# Altium schematic sheet Schematic_tm1637_.schdoc
size 281 x 104 mm
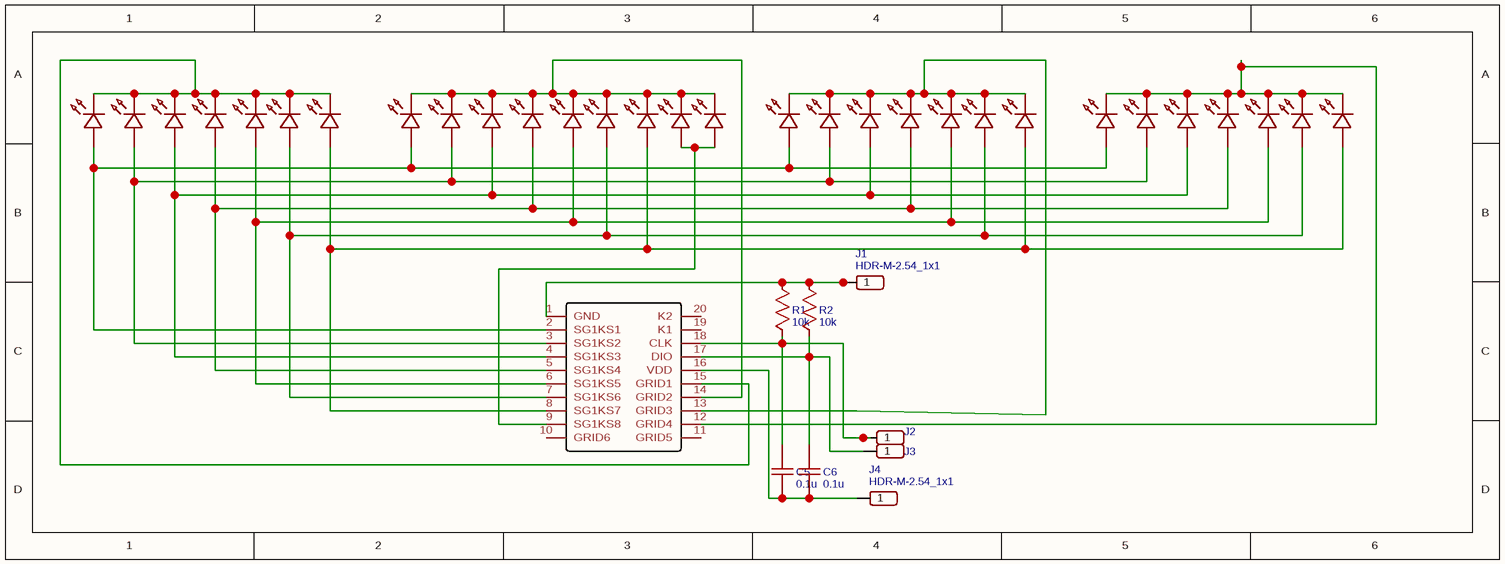
[diagram p0: Schematic_tm1637_.schdoc]

## Parts
A1  LED-TH-3mm_R  [LED-TH_BD3.0_RED]  (value not drawn)
A2  LED-TH-3mm_R  [LED-TH_BD3.0_RED]  (value not drawn)
A3  LED-TH-3mm_R  [LED-TH_BD3.0_RED]  (value not drawn)
A4  LED-TH-3mm_R  [LED-TH_BD3.0_RED]  (value not drawn)
B1  LED-TH-3mm_R  [LED-TH_BD3.0_RED]  (value not drawn)
B2  LED-TH-3mm_R  [LED-TH_BD3.0_RED]  (value not drawn)
B3  LED-TH-3mm_R  [LED-TH_BD3.0_RED]  (value not drawn)
B4  LED-TH-3mm_R  [LED-TH_BD3.0_RED]  (value not drawn)
C1  LED-TH-3mm_R  [LED-TH_BD3.0_RED]  (value not drawn)
C2  LED-TH-3mm_R  [LED-TH_BD3.0_RED]  (value not drawn)
C3  LED-TH-3mm_R  [LED-TH_BD3.0_RED]  (value not drawn)
C4  LED-TH-3mm_R  [LED-TH_BD3.0_RED]  (value not drawn)
C5  0.1u  [C1206]
C6  0.1u  [C1206]
D1  LED-TH-3mm_R  [LED-TH_BD3.0_RED]  (value not drawn)
D2  LED-TH-3mm_R  [LED-TH_BD3.0_RED]  (value not drawn)
D3  LED-TH-3mm_R  [LED-TH_BD3.0_RED]  (value not drawn)
D4  LED-TH-3mm_R  [LED-TH_BD3.0_RED]  (value not drawn)
E1  LED-TH-3mm_R  [LED-TH_BD3.0_RED]  (value not drawn)
E2  LED-TH-3mm_R  [LED-TH_BD3.0_RED]  (value not drawn)
E3  LED-TH-3mm_R  [LED-TH_BD3.0_RED]  (value not drawn)
E4  LED-TH-3mm_R  [LED-TH_BD3.0_RED]  (value not drawn)
F1  LED-TH-3mm_R  [LED-TH_BD3.0_RED]  (value not drawn)
F2  LED-TH-3mm_R  [LED-TH_BD3.0_RED]  (value not drawn)
F3  LED-TH-3mm_R  [LED-TH_BD3.0_RED]  (value not drawn)
F4  LED-TH-3mm_R  [LED-TH_BD3.0_RED]  (value not drawn)
G1  LED-TH-3mm_R  [LED-TH_BD3.0_RED]  (value not drawn)
G2  LED-TH-3mm_R  [LED-TH_BD3.0_RED]  (value not drawn)
G3  LED-TH-3mm_R  [LED-TH_BD3.0_RED]  (value not drawn)
G4  LED-TH-3mm_R  [LED-TH_BD3.0_RED]  (value not drawn)
J1  HDR-M-2.54_1x1  [HDR-M-2.54_1X1]
J2  HDR-M-2.54_1x1  [HDR-M-2.54_1X1]  (value not drawn)
J3  HDR-M-2.54_1x1  [HDR-M-2.54_1X1]  (value not drawn)
J4  HDR-M-2.54_1x1  [HDR-M-2.54_1X1]
K1  LED-TH-3mm_R  [LED-TH_BD3.0_RED]  (value not drawn)
K2  LED-TH-3mm_R  [LED-TH_BD3.0_RED]  (value not drawn)
R1  10k  [R1206]
R2  10k  [R1206]
U1  TM1637  [SOP-20_L12.8-W7.5-P1.27-LS10.4-BL]  (value not drawn)

## Nets
NetA1_1: A1.1 A2.1 A3.1 A4.1 U1.2(SG1KS1)
NetA1_2: A1.2 B1.2 C1.2 D1.2 E1.2 F1.2 G1.2 U1.15(GRID1)
NetA2_2: A2.2 B2.2 C2.2 D2.2 E2.2 F2.2 G2.2 K1.2 K2.2 U1.14(GRID2)
NetA3_2: A3.2 B3.2 C3.2 D3.2 E3.2 F3.2 G3.2 U1.13(GRID3)
NetA4_2: A4.2 B4.2 C4.2 D4.2 E4.2 F4.2 G4.2 U1.12(GRID4)
NetB1_1: B1.1 B2.1 B3.1 B4.1 U1.3(SG1KS2)
NetC1_1: C1.1 C2.1 C3.1 C4.1 U1.4(SG1KS3)
NetC5_1: C5.1 J2.1 R1.2 U1.18(CLK)
NetC5_2: C5.2 C6.2 J4.1 U1.16(VDD)
NetC6_1: C6.1 J3.1 R2.2 U1.17(DIO)
NetD1_1: D1.1 D2.1 D3.1 D4.1 U1.5(SG1KS4)
NetE1_1: E1.1 E2.1 E3.1 E4.1 U1.6(SG1KS5)
NetF1_1: F1.1 F2.1 F3.1 F4.1 U1.7(SG1KS6)
NetG1_1: G1.1 G2.1 G3.1 G4.1 U1.8(SG1KS7)
NetJ1_1: J1.1 R1.1 R2.1 U1.1(GND)
NetK1_1: K1.1 K2.1 U1.9(SG1KS8)

Not connected (* = marked no-connect by the designer): U1 10(GRID6) 11(GRID5) 19(K1) 20(K2)

## Library data of the parts
A1-A4 B1-B4 C1-C4 D1-D4 E1-E4 F1-F4 G1-G4 K1 K2 = LED-TH-3mm_R: Manufacturer: EVERLIGHT(台湾亿光); Manufacturer Part: 204-10SDRD/S530-A3-L; Contributor: LCEDA_Lib; Supplier Part: C84774; Supplier: LCSC; spicePre: L; spiceSymbolName: LED-TH-3mm_R
C5 C6 = 0.1u: nameAlias: Value(F); Contributor: LCEDA_Lib; spicePre: C; spiceSymbolName: C_1206_US
J1-J4 = HDR-M-2.54_1x1: Contributor: LCEDA_Lib; Supplier Part: C81276; Supplier: LCSC; spicePre: J; spiceSymbolName: HDR-M-2.54_1x1
R1 R2 = 10k: nameAlias: Value(Ω); Contributor: LCEDA_Lib; spicePre: R; spiceSymbolName: R_1206_US
U1 = TM1637: Manufacturer: TM(天微); Contributor: Tinkerforge; Supplier: LCSC; Manufacturer Part: TM1637; Supplier Part: C20001; JLCPCB Part Class: Extended Part; spicePre: U; spiceSymbolName: TM1637